# Altium schematic sheet Controller_Section.SchDoc
size A4; DocumentNumber: 4; SheetNumber: 4; SheetTotal: 7
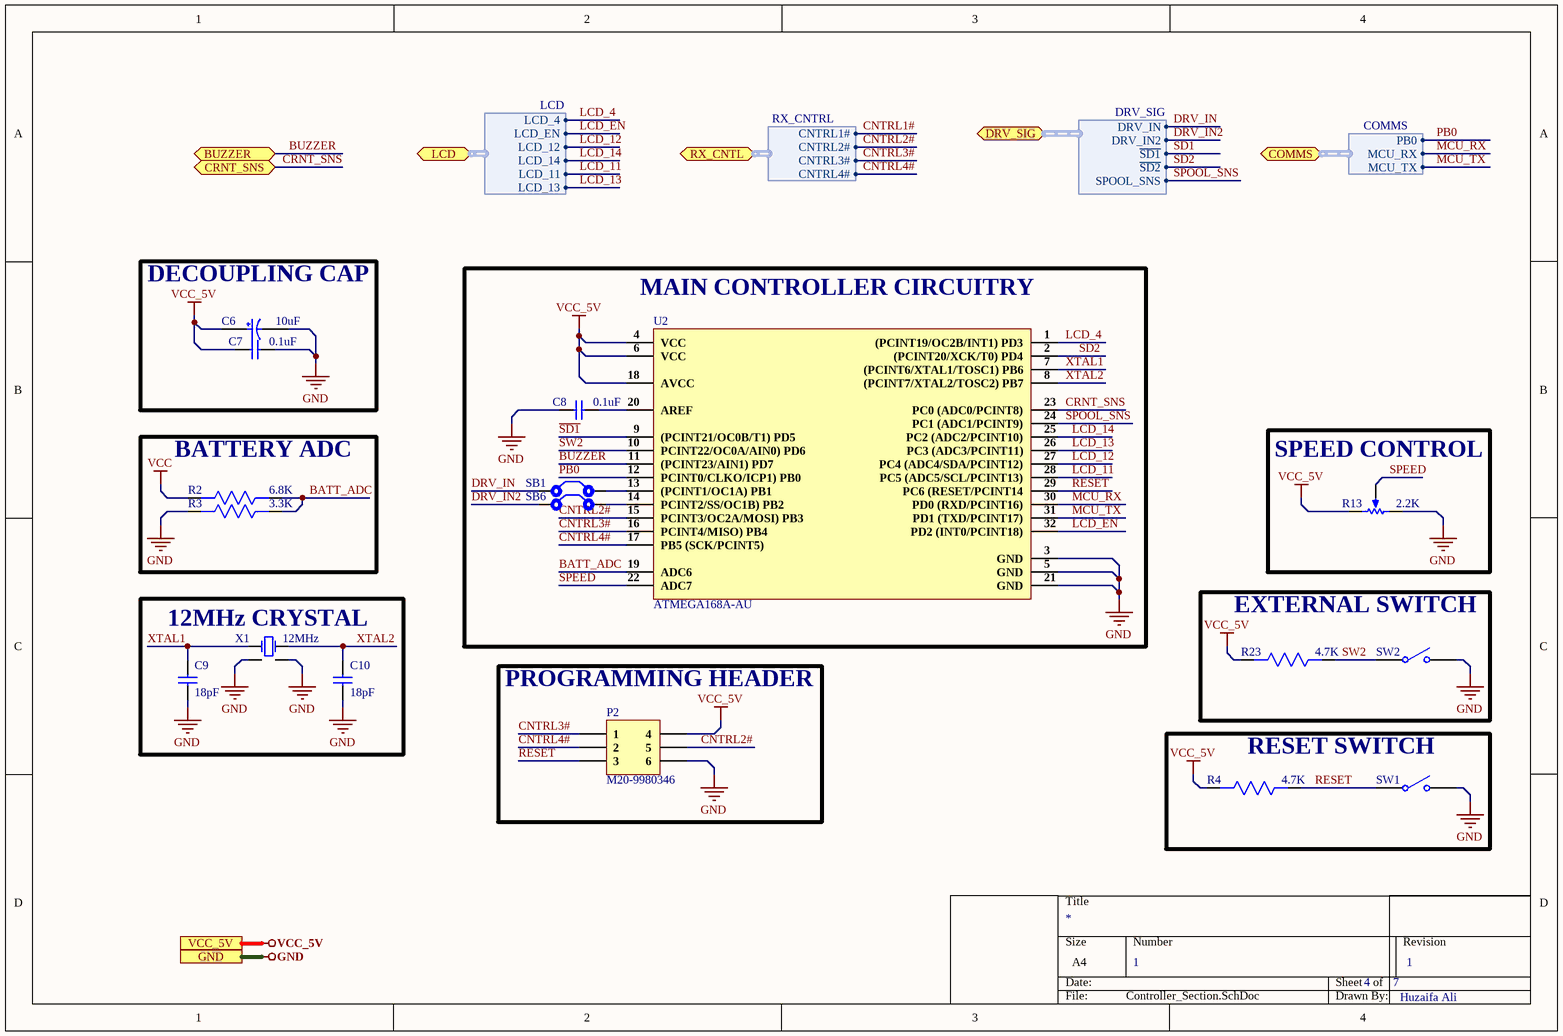
[diagram p0: Controller_Section.SchDoc]

## Parts
C6  10uF  [RVT1E100M0405.]
C7  0.1uF  [Cap0603]
C8  0.1uF  [Cap0603]
C9  18pF  [Cap0603]
C10  18pF  [Cap0603]
P2  M20-9980346  [HDR2X3]
R2  6.8K  [Res0603]
R3  3.3K  [Res0603]
R4  4.7K  [Res0603]
R13  2.2K  [VG039NCHXTB222]
R23  4.7K  [Res0603]
SB1  Solder Bridge  [Solder Bridge]  (value not drawn)
SB6  Solder Bridge  [Solder Bridge]  (value not drawn)
SW1  TS-1185EC-C-D-B  [TS-1185EC-C-D-B]  (value not drawn)
SW2  TS-1185EC-C-D-B  [TS-1185EC-C-D-B]  (value not drawn)
U2  ATMEGA168A-AU  [32-TQFP]
X1  12MHz  [X322512MOB4SI]

## Blocks framed on the sheet
DECOUPLING CAP: C6 C7
MAIN CONTROLLER CIRCUITRY: C8 SB1 SB6 U2
BATTERY ADC: R2 R3
SPEED CONTROL: R13
12MHz CRYSTAL: C9 C10 X1
EXTERNAL SWITCH: R23 SW2
PROGRAMMING HEADER: P2
RESET SWITCH: R4 SW1

## Ports
BUZZER (bidir), COMMS (bidir, harness COMMS), CRNT_SNS (bidir), DRV_SIG (bidir, harness DRV_SIG), GND, LCD (bidir, harness LCD), RX_CNTL (bidir, harness RX_CNTRL), VCC_5V

## Harnesses
RX_CNTRL: CNTRL1#, CNTRL2#, CNTRL3#, CNTRL4#
DRV_SIG: DRV_IN, DRV_IN2, ~{SD1}, ~{SD2}, SPOOL_SNS
LCD: LCD_4, LCD_EN, LCD_12, LCD_14, LCD_11, LCD_13
COMMS: PB0, MCU_RX, MCU_TX

## Nets
GND: C6.2 C7.2 C8.2 C9.1 C10.1 P2.6 R3.2 R13.3 SW1.2 SW2.2 U2.3(GND) U2.5(GND) U2.21(GND) X1.2(GND) X1.4(GND) ; port GND
VCC: R2.2
VCC_5V: C6.1 C7.1 P2.4 R4.2 R13.1 R23.2 U2.4(VCC) U2.6(VCC) U2.18(AVCC) ; port VCC_5V
~{SD1}: U2.9((PCINT21/OC0B/T1)_PD5) ; port DRV_SIG.~{SD1}
~{SD2}: U2.2((PCINT20/XCK/T0)_PD4) ; port DRV_SIG.~{SD2}
BATT_ADC: R2.1 R3.1 U2.19(ADC6)
BUZZER: U2.11((PCINT23/AIN1)_PD7) ; port BUZZER
CNTRL1#: port RX_CNTL.CNTRL1#
CNTRL2#: P2.5 U2.15(PCINT3/OC2A/MOSI)_PB3) ; port RX_CNTL.CNTRL2#
CNTRL3#: P2.1 U2.16(PCINT4/MISO)_PB4) ; port RX_CNTL.CNTRL3#
CNTRL4#: P2.2 U2.17(PB5_(SCK/PCINT5)) ; port RX_CNTL.CNTRL4#
CRNT_SNS: U2.23(PC0_(ADC0/PCINT8)) ; port CRNT_SNS
DRV_IN: SB1.1 ; port DRV_SIG.DRV_IN
DRV_IN2: SB6.1 ; port DRV_SIG.DRV_IN2
LCD_4: U2.1((PCINT19/OC2B/INT1)_PD3) ; port LCD.LCD_4
LCD_11: U2.28(PC5_(ADC5/SCL/PCINT13)) ; port LCD.LCD_11
LCD_12: U2.27(PC4_(ADC4/SDA/PCINT12)) ; port LCD.LCD_12
LCD_13: U2.26(PC3_(ADC3/PCINT11)) ; port LCD.LCD_13
LCD_14: U2.25(PC2_(ADC2/PCINT10)) ; port LCD.LCD_14
LCD_EN: U2.32(PD2_(INT0/PCINT18)) ; port LCD.LCD_EN
MCU_RX: U2.30(PD0_(RXD/PCINT16)) ; port COMMS.MCU_RX
MCU_TX: U2.31(PD1_(TXD/PCINT17)) ; port COMMS.MCU_TX
PB0: U2.12(PCINT0/CLKO/ICP1)_PB0) ; port COMMS.PB0
RESET: P2.3 R4.1 SW1.1 U2.29(PC6_(RESET/PCINT14)
SPEED: R13.2 U2.22(ADC7)
SPOOL_SNS: U2.24(PC1_(ADC1/PCINT9)) ; port DRV_SIG.SPOOL_SNS
SW2: R23.1 SW2.1 U2.10(PCINT22/OC0A/AIN0)_PD6)
XTAL1: C9.2 U2.7((PCINT6/XTAL1/TOSC1)_PB6) X1.1
XTAL2: C10.2 U2.8((PCINT7/XTAL2/TOSC2)_PB7) X1.3
NetC8_1: C8.1 U2.20(AREF)
NetSB1_2: SB1.2 U2.13((PCINT1/OC1A)_PB1)
NetSB6_2: SB6.2 U2.14(PCINT2/SS/OC1B)_PB2)

## Notes on the sheet
- 1
- Huzaifa Ali

## Library data of the parts
C6 = RVT1E100M0405: CAP ALUM 10uF 25V SMD; Manufacturer: ROQANG; φD: 4mm; L: 5.4mm; Tolerance: ±20%; Operating Temperature: -45℃~+105℃; Rated Voltage: 25V; Capacitance: 10uF
C7 C8 = CC0603KRX7R0BB104: CAP CER 0.1UF 100V X7R 0603; Manufacturer: Yageo; Capacitance: 100nF; Tolerance: 10%; Supplier 1: Digi-Key; Manufacturer Part Number: CC0603KRX7R0BB104; RoHS: Yes; Category: Ceramic Capacitors; Stock 1: 60476; Pricing 1: 1=0.19000, 10=0.13500, 50=0.07680, 100=0.06370, 500=0.04466, 1000=0.03696 (USD); Mount: Surface Mount; Case/Package: 0603; Case Code (Metric): 1608; Case Code (Imperial): 0603; Weight: 7.1E-05oz; Min Operating Temperature: -55°C; Max Operating Temperature: 125°C; Package Quantity: 4000; Voltage Rating: 100V; Packaging: Tape and Reel; Dielectric: X7R; Termination: SMD/SMT; Resistor Type: Ceramic; Voltage Rating (DC): 100V; Series: CC; Length: 0.063inch; Width: 0.031inch; Thickness: 0.035inch; Depth: 0.8mm; Lead Free: Lead Free; RoHS Compliant: Yes; ComponentLink1URL: https://datasheet.ciiva.com/6277/mlccorderingcode-6277030.pdf?src-supplier=Digi-Key; ComponentLink1Description: https://datasheet.ciiva.com/6277/mlccorderingcode-6277030.pdf?src-supplier=Digi-Key; ComponentLink2URL: https://datasheet.ciiva.com/6277/mlccorderingcode-6277081.pdf?src-supplier=Digi-Key; ComponentLink2Description: https://datasheet.ciiva.com/6277/mlccorderingcode-6277081.pdf?src-supplier=Digi-Key; ComponentLink3URL: https://datasheet.ciiva.com/6277/mlccorderingcode-6277082.pdf?src-supplier=Digi-Key; ComponentLink3Description: https://datasheet.ciiva.com/6277/mlccorderingcode-6277082.pdf?src-supplier=Digi-Key; Supplier Part Number 1: 311-1523-1-ND
C9 C10 = CC0603JRNPO9BN180: CAP CER 18pF 5% C0G 50V 0603 Paper T/R; Manufacturer: Yageo; Temperature Coefficient: 30ppm/°C; Insulation Resistance: 100GR; Supplier 1: Arrow Electronics; Manufacturer Part Number: CC0603JRNPO9BN180; RoHS: Yes; Category: Ceramic Capacitors; Stock 1: 4000; Pricing 1: 4000=0.00960, 8000=0.00660, 12000=0.00650, 28000=0.00640, 100000=0.00540 (USD); Mount: Surface Mount; Case/Package: 0603; Number of Pins: 2; Case Code (Metric): 1608; Case Code (Imperial): 0603; Min Operating Temperature: -55°C; Max Operating Temperature: 125°C; Tolerance: 5%; Capacitance: 18pF; Dielectric: C0G; Packaging: Tape and Reel; Voltage Rating: 50V; Voltage Rating (DC): 50V; Package Quantity: 1; Termination: SMD/SMT; Resistor Type: Ceramic; Series: CC; Length: 1.6mm; Width: 0.031inch; Height: 0.8mm; Thickness: 0.035inch; Depth: 0.8mm; Radiation Hardening: No; REACH SVHC: No SVHC; Lead Free: Lead Free; RoHS Compliant: Yes; ComponentLink1URL: https://datasheet.ciiva.com/144/mlccorderingcode-144638.pdf?src-supplier=Digi-Key; ComponentLink1Description: https://datasheet.ciiva.com/144/mlccorderingcode-144638.pdf?src-supplier=Digi-Key; ComponentLink2URL: https://datasheet.ciiva.com/144/mlccorderingcode-144637.pdf?src-supplier=Digi-Key; ComponentLink2Description: https://datasheet.ciiva.com/144/mlccorderingcode-144637.pdf?src-supplier=Digi-Key; ComponentLink3URL: https://datasheet.ciiva.com/144/mlccorderingcode-144639.pdf?src-supplier=Digi-Key; ComponentLink3Description: https://datasheet.ciiva.com/144/mlccorderingcode-144639.pdf?src-supplier=Digi-Key; ComponentLink4URL: https://datasheet.ciiva.com/28450/1443161-28450477.pdf?src-supplier=Element14; ComponentLink4Description: https://datasheet.ciiva.com/28450/1443161-28450477.pdf?src-supplier=Element14; ComponentLink5URL: https://datasheet.ciiva.com/46430/1835847-46430152.pdf?src-supplier=Element14; ComponentLink5Description: https://datasheet.ciiva.com/46430/1835847-46430152.pdf?src-supplier=Element14; ComponentLink6URL: https://datasheet.ciiva.com/5425/upy-gp-np0-16v-to-50v-8-5425439.pdf?src-supplier=Mouser; ComponentLink6Description: https://datasheet.ciiva.com/5425/upy-gp-np0-16v-to-50v-8-5425439.pdf?src-supplier=Mouser; ComponentLink7URL: https://datasheet.ciiva.com/8033/1734582-8033733.pdf?src-supplier=Element14; ComponentLink7Description: https://datasheet.ciiva.com/8033/1734582-8033733.pdf?src-supplier=Element14; ComponentLink8URL: https://datasheet.ciiva.com/11587/upy-gp-np0-16v-to-50v-8-11587323.pdf?src-supplier=Avnet; ComponentLink8Description: https://datasheet.ciiva.com/11587/upy-gp-np0-16v-to-50v-8-11587323.pdf?src-supplier=Avnet; Supplier Part Number 1: CC0603JRNPO9BN180
P2 = M20-9980346: CONN HEADER VERT 6POS 2.54MM; Manufacturer: Harwin; Number of Contacts: 6; Contact Resistance: 25mR; Current Rating: 3A; Gender: Male; Insulation Resistance: 10GR; Connector Type: Male Pin; Row Spacing: 0.1inch; Supplier 1: Digi-Key; Manufacturer Part Number: M20-9980346; Stock 1: 19517; Pricing 1: 1=0.24, 10=0.229, 100=0.1586, 500=0.1342, 1000=0.1098, 5000=0.0976, 10000=0.08845 (USD); Mount: Through Hole; Contact Plating: Tin; Color: Black; Contact Material: Bronze,Brass; Housing Color: Black; Housing Material: Nylon; Min Operating Temperature: -40°C; Max Operating Temperature: 105°C; Number of Rows: 2; Termination: Solder; Package Quantity: 1000; Packaging: Bag; Max Current Rating: 3A; Number of Positions: 6; Orientation: Straight; Length: 7.62mm; Pitch: 2.54mm; Contact Mating Length: 0.24inch; Depth: 5.08mm; Radiation Hardening: No; REACH SVHC: No SVHC; ComponentLink1URL: http://uk.rs-online.com/webdocs/1406/0900766b81406898.pdf?src-supplier=RSComponents; ComponentLink1Description: http://uk.rs-online.com/webdocs/1406/0900766b81406898.pdf?src-supplier=RSComponents; ComponentLink2URL: https://www.verical.com/server-webapp/html/getDatasheet?partID=483857&src-supplier=Verical; ComponentLink2Description: https://www.verical.com/server-webapp/html/getDatasheet?partID=483857&src-supplier=Verical; ComponentLink3URL: http://www.farnell.com/datasheets/2368211.pdf?src-supplier=Element14; ComponentLink3Description: http://www.farnell.com/datasheets/2368211.pdf?src-supplier=Element14; Supplier Part Number 1: 952-2121-ND
R2 = TC0325B6801T5F: 6.8kΩ 0603 Chip Resistor - Surface Mount ROHS; Manufacturer: UNI-ROYAL; Manufacturer Part Number: TC0325B6801T5F; Footprint: 0603; ComponentLink1Description: LCSC; ComponentLink1URL: https://lcsc.com/product-detail/Chip-span-style-background-color-ff0-Resistor-span-Surface-Mount_UNI-ROYAL-Uniroyal-Elec-TC0325B6801T5F_C2982989.html
R3 = RT0603BRD073K3L: RES SMD 3.3K OHM 0.1% 1/10W 0603; Manufacturer: Yageo; Resistance: 3.3kR; Power Rating: 100mW; Voltage Rating: 75V; Temperature Coefficient: 25ppm/°C; Voltage Rating (DC): 50V; Supplier 1: Newark; Manufacturer Part Number: RT0603BRD073K3L; RoHS: Yes; Category: Chip SMD Resistors; Stock 1: 7026; Pricing 1: 1=0.26300, 10=0.16400, 25=0.12800, 50=0.09300, 100=0.05700 (USD); Case/Package: 0603; Case Code (Metric): 1608; Case Code (Imperial): 0603; Contact Plating: Tin,Lead; Min Operating Temperature: -55°C; Max Operating Temperature: 125°C; Package Quantity: 5000; Packaging: Tape and Reel; Tolerance: 0.1%; Resistor Type: Thin Film; Number of Terminations: 2; Termination: SMD/SMT; Max Power Dissipation: 100mW; Features: Moisture Resistant; Series: RT; Construction: Rectangular; Length: 0.063inch; Width: 0.031inch; Height: 0.022inch; Depth: 0.8mm; Military Standard: Not; Lead Free: Lead Free; RoHS Compliant: Yes; ComponentLink1URL: https://datasheet.ciiva.com/11814/0900766b8027bd26-11814026.pdf?src-supplier=RSComponents; ComponentLink1Description: https://datasheet.ciiva.com/11814/0900766b8027bd26-11814026.pdf?src-supplier=RSComponents; ComponentLink2URL: https://datasheet.ciiva.com/2585/pyu-rt-1-to-0-05-rohs-l-4-2585926.pdf?src-supplier=Digi-Key; ComponentLink2Description: https://datasheet.ciiva.com/2585/pyu-rt-1-to-0-05-rohs-l-4-2585926.pdf?src-supplier=Digi-Key; ComponentLink3URL: https://datasheet.ciiva.com/12694/pyu-rt-1-to-0-05-rohs-l-4-12694839.pdf?src-supplier=Mouser; ComponentLink3Description: https://datasheet.ciiva.com/12694/pyu-rt-1-to-0-05-rohs-l-4-12694839.pdf?src-supplier=Mouser; Supplier Part Number 1: 82AH8918
R4 R23 = AT0603BRD074K7L: RES SMD 4.7K OHM 0.1% 1/10W 0603; Manufacturer: Yageo; Resistance: 4.7kR; Max Power Dissipation: 100mW; Temperature Coefficient: 25ppm/°C; Supplier 1: Digi-Key; Manufacturer Part Number: AT0603BRD074K7L; Stock 1: 7928; Pricing 1: 1=0.56, 10=0.431, 100=0.181, 1000=0.09986, 2500=0.09362 (USD); Case/Package: 0603; Case Code (Metric): 1608; Case Code (Imperial): 0603; Min Operating Temperature: -55°C; Max Operating Temperature: 155°C; Packaging: Tape and Reel; Composition: Thin Film; Number of Terminations: 2; Tolerance: 0.1%; Features: Anti-Sulfur,Automotive AEC-Q200,Moisture Resistant; Length: 0.063inch; Height: 0.022inch; Width: 0.032inch; Supplier Part Number 1: YAG2113CT-ND
R13 = VG039NCHXTB222: 2.2kΩ SMD Variable Resistors/Potentiometers ROHS; Manufacturer: HDK; Manufacturer Part Number: VG039NCHXTB222; Footprint: Custom; ComponentLink1Description: LCSC; ComponentLink1URL: https://lcsc.com/product-detail/Variable-Resistors-Potentiometers_HDK-Hokuriku-Elec-Industry-VG039NCHXTB222_C145162.html
SB1 SB6 = Solder Bridge: Solder Bridge ON
SW1 SW2 = TS-1185EC-C-D-B: 3mm 2mm Round Button 50mA Top3.65mm SPST 12V SMD Tactile Switches; Manufacturer: XKB; Manufacturer Part No: TS-1185EC-C-D-B; Package: Custom; ComponentLink1Description: LCSC; ComponentLink1URL: https://lcsc.com/product-detail/Tactile-Switches_XKB-Connectivity-TS-1185EC-C-D-B_C318893.html
U2 = ATMEGA168A-AU: IC MCU 8BIT 16KB FLASH 32TQFP; Manufacturer: Microchip / Atmel; Interface: SPI,2-Wire,I2C,UART,USART,Serial; Number of I/Os: 23; Frequency: 20MHz; Oscillator Type: Internal; Peripherals: Brown-out Detect/Reset,POR,PWM,WDT; Core Architecture: AVR; RAM Size: 1KB; Number of Timers/Counters: 3; Max Supply Voltage: 5.5V; Min Supply Voltage: 1.8V; Data Bus Width: 8b; Watchdog Timer: Yes; Number of PWM Channels: 6; Number of ADC Channels: 8; Number of SPI Channels: 1; Supplier 1: RSComponents; Manufacturer Part Number: ATMEGA168A-AU; RoHS: Yes; Category: Microcontrollers; Mount: Surface Mount; Case/Package: A; Number of Pins: 32; Contact Plating: Tin,Matte; Min Operating Temperature: -40°C; Max Operating Temperature: 85°C; Packaging: Tray; Memory Type: FLASH; Memory Size: 16KB; Series: AVR® ATmega; Package Quantity: 250; Number of Programmable I/O: 23; Max Frequency: 20MHz; Number of I2C Channels: 1; Length: 7mm; Width: 7mm; Height: 1.05mm; Radiation Hardening: No; RoHS Compliant: Yes; REACH SVHC: No SVHC; Lead Free: Lead Free; ComponentLink1URL: https://datasheet.ciiva.com/4837/doc8271-50296-4837968.pdf?src-supplier=Mouser; ComponentLink1Description: https://datasheet.ciiva.com/4837/doc8271-50296-4837968.pdf?src-supplier=Mouser; ComponentLink2URL: https://datasheet.ciiva.com/22651/1691443-22651039.pdf?src-supplier=Farnell; ComponentLink2Description: https://datasheet.ciiva.com/22651/1691443-22651039.pdf?src-supplier=Farnell; ComponentLink3URL: https://datasheet.ciiva.com/1157/1691443-1157400.pdf?src-supplier=Element14; ComponentLink3Description: https://datasheet.ciiva.com/1157/1691443-1157400.pdf?src-supplier=Element14; Supplier Part Number 1: 7153782
X1 = X322512MOB4SI: 12MHz SMD Crystal Resonator 12pF ±10ppm ±30ppm -40℃~+85℃ SMD3225-4P Crystals ROHS; Manufacturer: Yangxing Tech; Manufacturer Part Number: X322512MOB4SI; Value: 12MHz; Footprint: Custom